# EAGLE board BDC-REV1 (EAGLE 9.6.2)
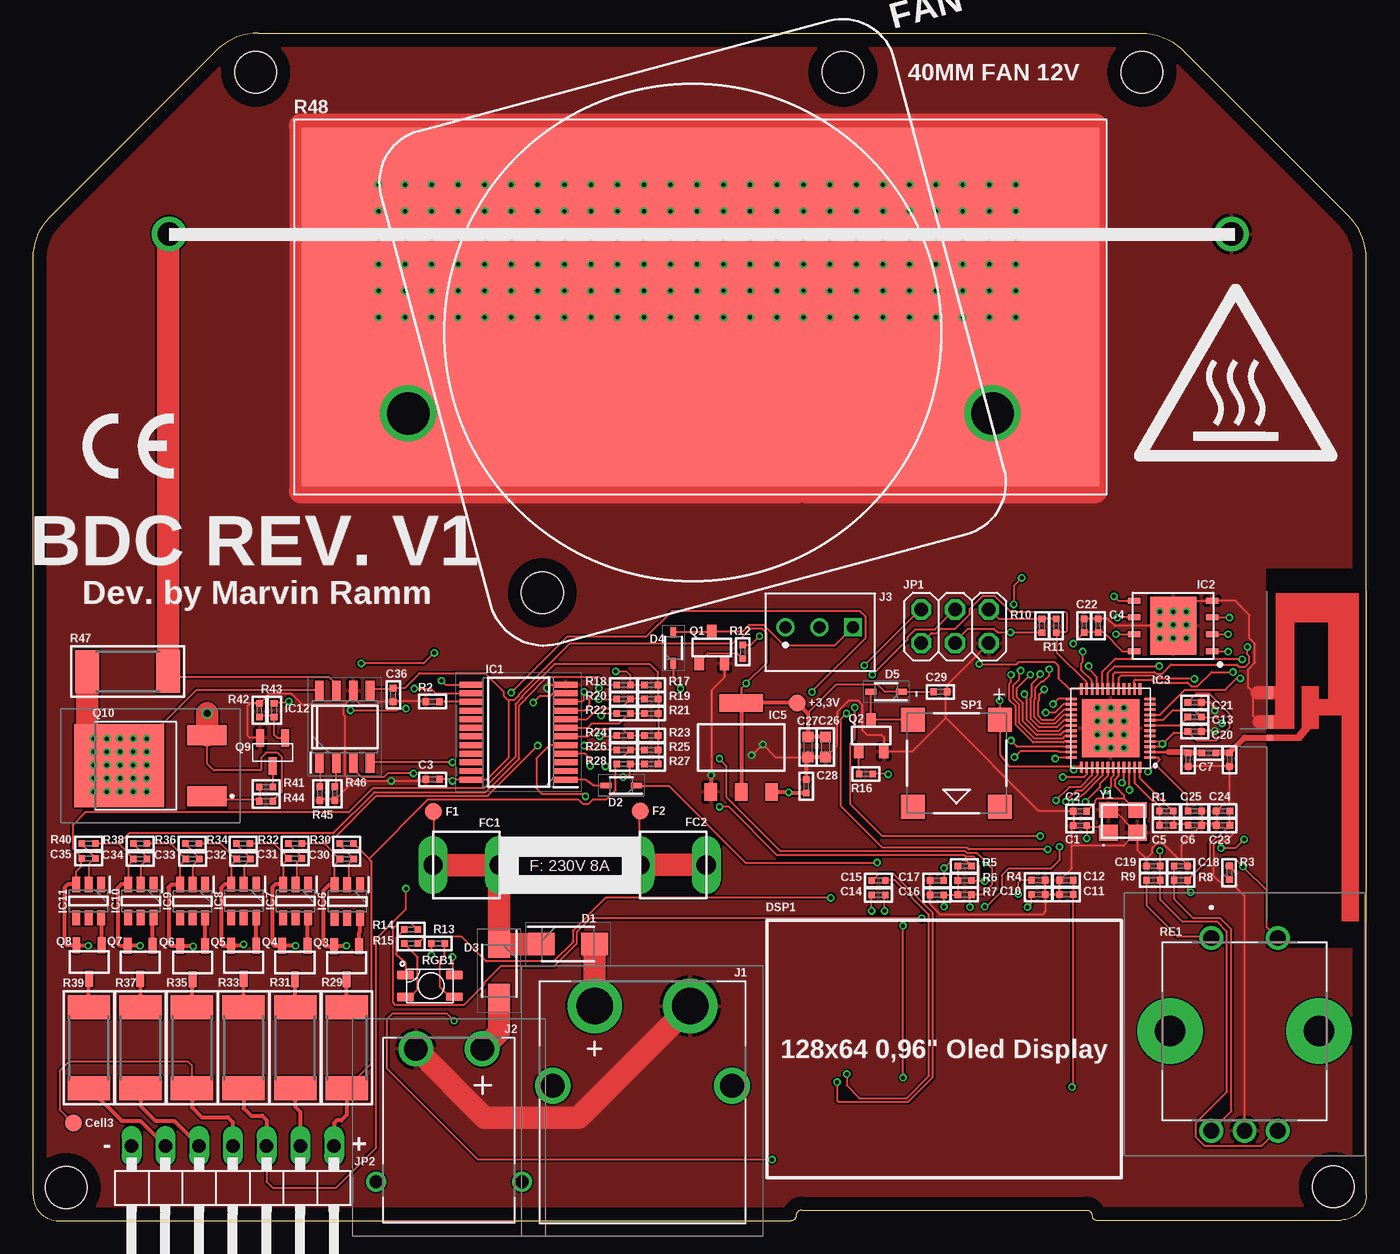
[diagram p2: board, top side]
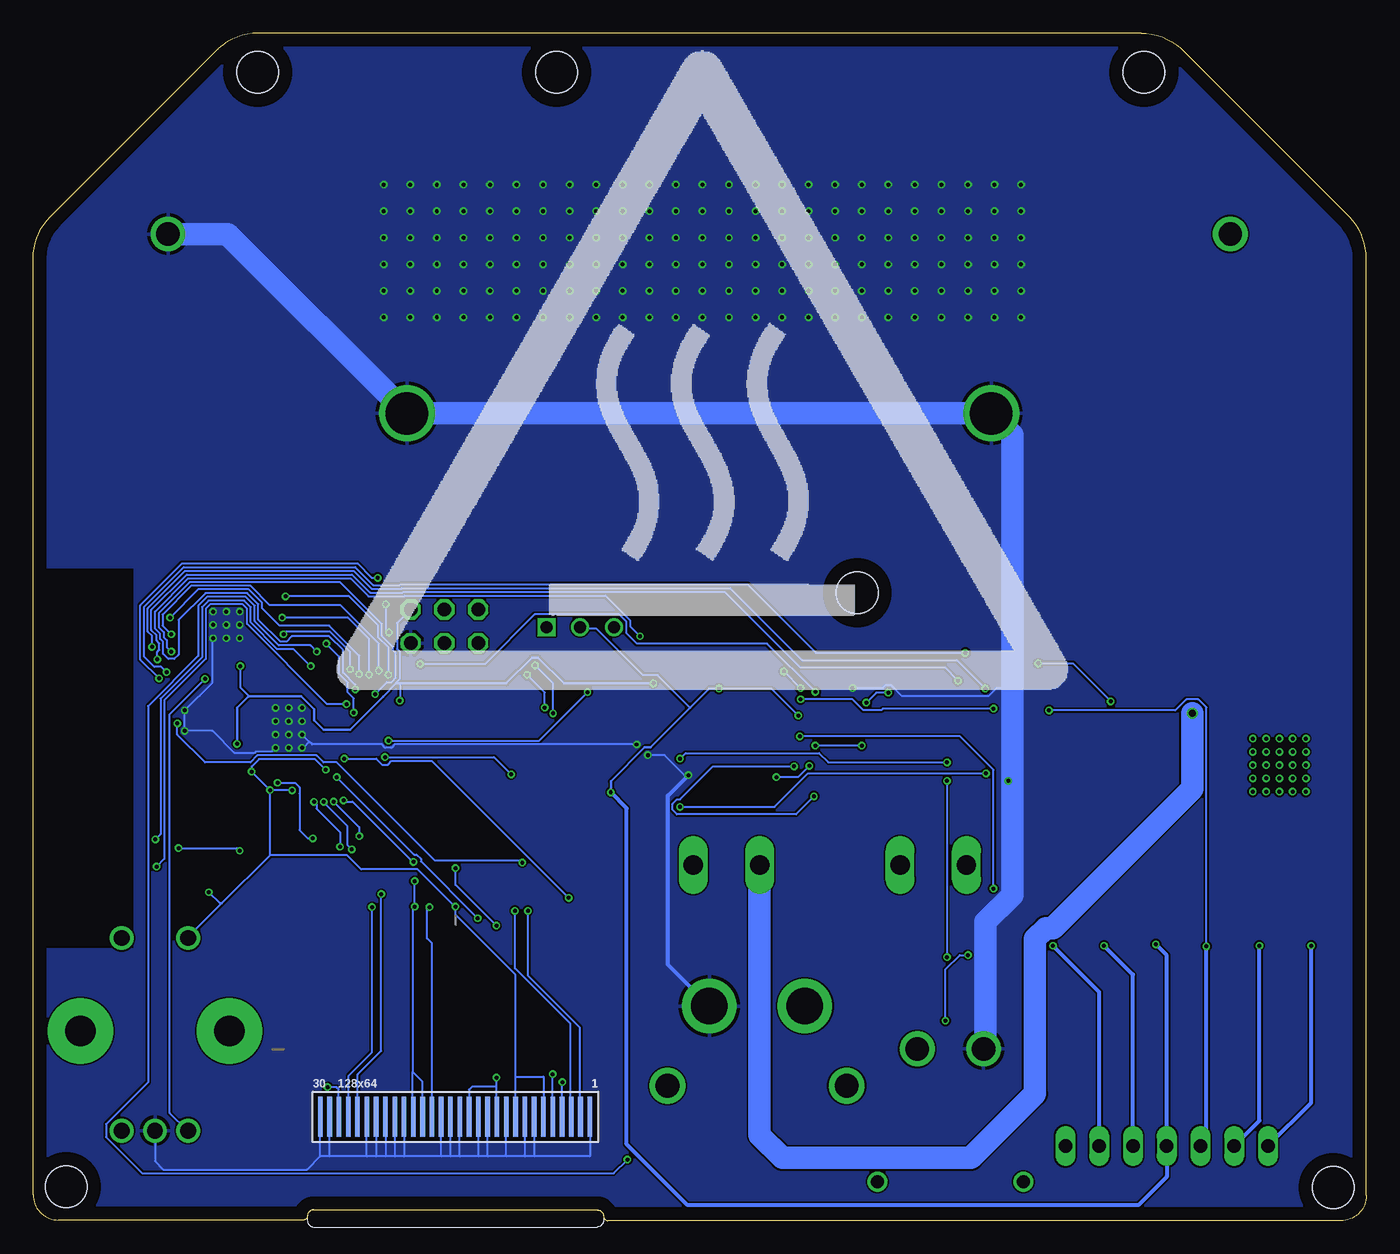
[diagram p3: board, bottom side, seen from below]

Size 100.4 x 89.4 mm. Coordinates in mm from the lower left corner, seen from the top.
Outline: 1.9,0 57.1,0 arc90 57.45,0.35 arc-90 57.9,0.8 79.3,0.8 arc-90 79.75,0.35 arc90 80.05,0.05 98.5,0.05 arc90 100.4,1.95 100.4,72.45 arc49 98.85,75.85 86.45,88.25 arc42 83.45,89.4 16.95,89.4 arc41 14,88.3 1.5,75.8 arc48 0,72.45 0,1.9 arc90 1.9,0
Copper layers (1*16): Top 0.035mm / dielectric 1.53mm / Bottom 0.035mm
Design rules "JLCPCB_1-2layer *": minimum track width 6mil, minimum drill 0.3mm, track to track 5mil, track to pad 0.2mm, pad to pad 7mil, via to via 7mil, smd to smd 7mil, copper to edge 40mil, drill to drill 6mil, minimum pad ring 6mil, minimum via ring 0.13mm, stop-mask expansion 0.1mm, vias tented up to drill 20mil, thermal gap 10mil
Holes 3.15 mm at 2.5,2.5 97.9,2.55 83.5,86.45 16.75,86.45
tRestrict: area 92.8,21.2 to 100.4,49.1; area 92.9,20.6 to 100.4,21.2; area 92.8,20.6 to 92.9,21.2
bRestrict: area 92.8,21.2 to 100.4,49.1; area 92.8,20.6 to 100.4,21.2; area 57.8,5.8 to 79.4,9.8

## Footprints (pad centres in the part's own frame; a part is rotated, then mirrored left to right if it is on the bottom)
C0402 = smd 0.5 x 0.5: 1 -0.508,0; 2 0.508,0
C0603 = smd 0.8 x 0.8: 1 -0.762,0; 2 0.762,0
SODFL5026X120N = smd 2.02 x 1.67: 1 -2,0; 2 2,0
SODFL2512X90N = smd 0.82 x 0.42: 1 -1.15,0; 2 1.15,0
2864KSWE_128X64I2C = smd 0.35 x 3: D1 0.175,1.5; D2 0.875,1.5; D3 1.575,1.5; D4 2.275,1.5; D5 2.975,1.5; D6 3.675,1.5; D7 4.375,1.5; D8 5.075,1.5; D9 5.775,1.5; D10 6.475,1.5; D11 7.175,1.5; D12 7.875,1.5; D13 8.575,1.5; D14 9.275,1.5; D15 9.975,1.5; D16 10.675,1.5; D17 11.375,1.5; D18 12.075,1.5; D19 12.775,1.5; D20 13.475,1.5; D21 14.175,1.5; D22 14.875,1.5; D23 15.575,1.5; D24 16.275,1.5; D25 16.975,1.5; D26 17.675,1.5; D27 18.375,1.5; D28 19.075,1.5; D29 19.775,1.5; D30 20.475,1.5
TRACE_ANTENNA_2.4GHZ_25.7MM_TUNED = smd 0.46 x 0.46: ANT 0,0.23 | smd 1 x 0.46: GND -1.18,0.23; GND2 -3.38,0.23
FUSECLIP = drill 1.448 pad 1.905 long: P1 0,0; P2 5,0
SOP65P780X200-24N = smd 1.8 x 0.45: 1 -3.55,3.575; 2 -3.55,2.925; 3 -3.55,2.275; 4 -3.55,1.625; 5 -3.55,0.975; 6 -3.55,0.325; 7 -3.55,-0.325; 8 -3.55,-0.975; 9 -3.55,-1.625; 10 -3.55,-2.275; 11 -3.55,-2.925; 12 -3.55,-3.575; 13 3.55,-3.575; 14 3.55,-2.925; 15 3.55,-2.275; 16 3.55,-1.625; 17 3.55,-0.975; 18 3.55,-0.325; 19 3.55,0.325; 20 3.55,0.975; 21 3.55,1.625; 22 3.55,2.275; 23 3.55,2.925; 24 3.55,3.575
SON127P800X600X80-9N = smd 0.95 x 0.45: 1 -2.85,1.905; 2 -2.85,0.635; 3 -2.85,-0.635; 4 -2.85,-1.905; 5 3,-1.905; 6 3,-0.635; 7 3,0.635; 8 3,1.905 | smd 3.45 x 4.35: 9 0.05,0
QFN40P600X600X90-49N = smd 0.85 x 0.2: 1 -2.95,2.2; 2 -2.95,1.8; 3 -2.95,1.4; 4 -2.95,1; 5 -2.95,0.6; 6 -2.95,0.2; 7 -2.95,-0.2; 8 -2.95,-0.6; 9 -2.95,-1; 10 -2.95,-1.4; 11 -2.95,-1.8; 12 -2.95,-2.2; 25 2.95,-2.2; 26 2.95,-1.8; 27 2.95,-1.4; 28 2.95,-1; 29 2.95,-0.6; 30 2.95,-0.2; 31 2.95,0.2; 32 2.95,0.6; 33 2.95,1; 34 2.95,1.4; 35 2.95,1.8; 36 2.95,2.2 | smd 0.2 x 0.85: 13 -2.2,-2.95; 14 -1.8,-2.95; 15 -1.4,-2.95; 16 -1,-2.95; 17 -0.6,-2.95; 18 -0.2,-2.95; 19 0.2,-2.95; 20 0.6,-2.95; 21 1,-2.95; 22 1.4,-2.95; 23 1.8,-2.95; 24 2.2,-2.95; 37 2.2,2.95; 38 1.8,2.95; 39 1.4,2.95; 40 1,2.95; 41 0.6,2.95; 42 0.2,2.95; 43 -0.2,2.95; 44 -0.6,2.95; 45 -1,2.95; 46 -1.4,2.95; 47 -1.8,2.95; 48 -2.2,2.95 | smd 4.35 x 4.35: 49 0,0
SOT229P700X180-4N = smd 1.3 x 0.95: 1 -3.35,2.29; 2 -3.35,0; 3 -3.35,-2.29 | smd 1.3 x 3.25: 4 3.35,0
SOT95P280X140-6N = smd 1.15 x 0.6: 1 -1.25,0.95; 2 -1.25,0; 3 -1.25,-0.95; 4 1.25,-0.95; 5 1.25,0; 6 1.25,0.95
SOIC127P600X175-8N = smd 1.528 x 0.65: 1 -2.711,1.905; 2 -2.711,0.635; 3 -2.711,-0.635; 4 -2.711,-1.905; 5 2.711,-1.905; 6 2.711,-0.635; 7 2.711,0.635; 8 2.711,1.905
XT60PWM = drill 2.75 pad 4.1: 1 -3.6,0; 2 3.6,0 | drill 1.8 pad 2.7: 3 6.75,6; 4 -6.75,6
XT30PWM = drill 1.75 pad 2.6: 1 -2.5,-5.912; 2 2.5,-5.912 | drill 1 pad 1.5: 3 5.5,4.088; 4 -5.5,4.088
2510-3A = drill 0.9: 1 0.02,-0.01; 2 2.56,-0.01 | drill 0.9 square: 3 5.1,-0.01
2X03 = drill 1.016 octagon: 1 -2.54,-1.27; 2 -2.54,1.27; 3 0,-1.27; 4 0,1.27; 5 2.54,-1.27; 6 2.54,1.27
1X07/90 = drill 1.016 long: 1 -7.62,-3.81; 2 -5.08,-3.81; 3 -2.54,-3.81; 4 0,-3.81; 5 2.54,-3.81; 6 5.08,-3.81; 7 7.62,-3.81
SOT95P240X120-3N = smd 1 x 0.7: 1 -1.2,0.95; 2 -1.2,-0.95; 3 1.2,0
FSS2302SA2SHB = smd 1.2 x 0.6: D 1.25,0; G -1.25,0.95; S -1.25,-0.95
SOT95P237X112-3N = smd 1.3 x 0.6: 1 -1.05,0.95; 2 -1.05,-0.95; 3 1.05,0
AOD480 = smd 1.5 x 3: 1 -2.286,-8.4; 3 2.286,-8.4 | smd 6.25 x 6.8: 2 0,-1.8
R0402 = smd 0.5 x 0.5: 1 -0.508,0; 2 0.508,0
R2512 = smd 1.8 x 3.2: 1 -3.048,0; 2 3.048,0
RX24_100W = drill 1.75: 1 -16.2,14.7; 2 63.8,14.7 | drill 3.2: GND 1.8,1.2; GND2 45.8,1.2 | smd 60 x 27: GND3 23.8,9.2
PEC12R4230FS0024 = drill 1.2 pad 1.8: 1 0,0; 2 5,0; A1 0,-14.5; B1 5,-14.5; C1 2.5,-14.5 | drill 2.3 pad 4.92: MH1 -3.1,-7; MH2 8.1,-7
RGBLED = smd 0.686 x 1.3: +5V -1.456,1.996; P1 0.184,1.996; P2 -1.458,-1.678; P3 0.192,-1.678
XDCR_CMT-7525-80-SMT-TR = smd 1.8 x 1.8: 1 3.275,3.275; 2 3.275,-3.275; N -3.275,-3.275; P -3.275,3.275
PAD.03X.05 = smd 1.27 x 1.27: P$1 0,0
40MMFAN = hole 3.15: 4.45,4.06; 36.45,36.06
SMD3225_4P16MHZ20PF10PPM4085 = smd 1.4 x 1.2: 1 -1.1,-0.85; 2 1.1,-0.85; 3 1.1,0.85; 4 -1.1,0.85

## Placement (x,y rotation side)
C1  12pF  [C0402]  78.83,29.75 0 top
C2  12pF  [C0402]  78.83,30.82 0 top
C3  0,1µF  [C0402]  30.09,33.23 180 top
C4  0,1uF  [C0402]  80.21,44.8 270 top
C5  3nF  [C0402]  85.33,29.77 180 top
C6  10nF  [C0402]  87.48,29.77 180 top
C7  5,6pF  [C0402]  88.53,35.22 0 top
C8  DNP  [C0402]  90.09,34.71 90 top
C9  DNP  [C0402]  86.98,34.71 90 top
C10  1µF  [C0402]  75.69,24.56 180 top
C11  1µF  [C0402]  77.8,24.56 0 top
C12  1µF  [C0402]  77.8,25.63 0 top
C13  270pF  [C0402]  87.47,37.92 180 top
C14  1µF  [C0402]  63.66,24.52 0 top
C15  1µF  [C0402]  63.66,25.6 0 top
C16  1µF  [C0402]  68.06,24.53 180 top
C17  1µF  [C0402]  68.06,25.62 180 top
C18  10nF  [C0402]  86.43,26.69 0 top
C19  10nF  [C0402]  84.35,26.69 180 top
C20  0,1uF  [C0402]  87.47,36.83 180 top
C21  0,1uF  [C0402]  87.47,39.01 180 top
C22  1uF  [C0402]  79.14,44.8 270 top
C23  100pF  [C0402]  89.61,29.77 0 top
C24  0,1uF  [C0402]  89.61,30.84 0 top
C25  0,1uF  [C0402]  87.48,30.84 180 top
C26  10µF  [C0603]  59.67,35.66 270 top
C27  10µF  [C0603]  58.35,35.66 270 top
C28  4,7uF  [C0402]  58.22,32.7 270 top
C29  1uF  [C0402]  68.32,39.82 0 top
C30  100nF  [C0402]  23.62,27.23 180 top
C31  100nF  [C0402]  19.73,27.28 180 top
C32  100nF  [C0402]  15.84,27.23 180 top
C33  100nF  [C0402]  12,27.23 180 top
C34  100nF  [C0402]  8.06,27.23 180 top
C35  100nF  [C0402]  4.17,27.28 180 top
C36  100nF  [C0402]  27.11,39.58 270 top
D1  SK53AFL-TP  [SODFL5026X120N]  40.27,20.83 0 top
D2  1N4148WS  [SODFL2512X90N]  44.29,32.77 180 top
D3  SK53AFL-TP  [SODFL5026X120N]  35.09,18.81 270 top
D4  1N4148WS  [SODFL2512X90N]  48.22,43.13 90 top
D5  1N4148WS  [SODFL2512X90N]  64.25,39.82 180 top
DSP1  2864KSWE_128X64I2C  [2864KSWE_128X64I2C]  78.95,6.32 0 bottom
E1  ANTENNA  [TRACE_ANTENNA_2.4GHZ_25.7MM_TUNED]  92.89,36.37 270 top
FC1  FUSECLIPS  [FUSECLIP]  30.11,26.77 0 top
FC2  FUSECLIPS  [FUSECLIP]  50.69,26.78 180 top
IC1  CD74HC4067SM96  [SOP65P780X200-24N]  36.55,36.78 180 top
IC2  W25Q128JVPIQ  [SON127P800X600X80-9N]  85.92,44.78 180 top
IC3  ESP32-D0WDQ6  [QFN40P600X600X90-49N]  81.14,37.08 180 top
IC5  AMS1117-3.3  [SOT229P700X180-4N]  53.33,35.63 90 top
IC6  HY2213-BB3A  [SOT95P280X140-6N]  23.66,24.04 270 top
IC7  HY2213-BB3A  [SOT95P280X140-6N]  19.76,24.06 270 top
IC8  HY2213-BB3A  [SOT95P280X140-6N]  15.86,24.08 270 top
IC9  HY2213-BB3A  [SOT95P280X140-6N]  12.01,24.05 270 top
IC10  HY2213-BB3A  [SOT95P280X140-6N]  8.11,24.07 270 top
IC11  HY2213-BB3A  [SOT95P280X140-6N]  4.18,24.06 270 top
IC12  INA219AIDR  [SOIC127P600X175-8N]  23.47,37.18 90 top
J1  XT60PW-M  [XT60PWM]  45.88,16.16 180 top
J2  XT30PW-M  [XT30PWM]  31.32,7.02 180 top
J3  2510-3A  [2510-3A]  56.65,44.7 0 top
JP1  [2X03]  69.43,44.75 0 top
JP2  [1X07/90]  15.03,1.82 180 top
Q1  MMBT3904  [SOT95P240X120-3N]  51.11,43.15 90 top
Q2  MMBT3904  [SOT95P240X120-3N]  63.11,36.52 90 top
Q3  FSS2302SA2SHB  [FSS2302SA2SHB]  23.61,19.42 270 top
Q4  FSS2302SA2SHB  [FSS2302SA2SHB]  19.71,19.44 270 top
Q5  FSS2302SA2SHB  [FSS2302SA2SHB]  15.86,19.46 270 top
Q6  FSS2302SA2SHB  [FSS2302SA2SHB]  12.01,19.43 270 top
Q7  FSS2302SA2SHB  [FSS2302SA2SHB]  8.06,19.45 270 top
Q8  FSS2302SA2SHB  [FSS2302SA2SHB]  4.21,19.47 270 top
Q9  SI2302DDS-T1-GE3  [SOT95P237X112-3N]  18.04,35.29 270 top
Q10  AOD403  [AOD480]  4.68,34.25 90 top
R1  20kΩ  [R0402]  85.33,30.83 0 top
R2  10kΩ  [R0402]  30.07,39.07 180 top
R3  10kΩ  [R0402]  90.08,26.19 270 top
R4  390kΩ  [R0402]  75.7,25.63 0 top
R5  10kΩ  [R0402]  70.15,26.69 180 top
R6  10kΩ  [R0402]  70.15,25.62 0 top
R7  10kΩ  [R0402]  70.15,24.54 0 top
R8  10kΩ  [R0402]  86.43,25.63 180 top
R9  10kΩ  [R0402]  84.35,25.63 0 top
R10  10kΩ  [R0402]  75.97,44.79 90 top
R11  10kΩ  [R0402]  77.04,44.79 270 top
R12  1kΩ  [R0402]  53.43,42.82 270 top
R13  2,2kΩ  [R0402]  30.49,20.86 180 top
R14  2,2kΩ  [R0402]  28.45,21.93 0 top
R15  2,2kΩ  [R0402]  28.45,20.86 0 top
R16  1kΩ  [R0402]  62.71,33.62 180 top
R17  365kΩ  [R0402]  46.55,40.33 180 top
R18  100kΩ  [R0402]  44.46,40.33 0 top
R19  64,9kΩ  [R0402]  46.55,39.27 180 top
R20  100kΩ  [R0402]  44.46,39.27 0 top
R21  35,7kΩ  [R0402]  46.55,38.19 180 top
R22  100kΩ  [R0402]  44.46,38.19 0 top
R23  24,9kΩ  [R0402]  46.55,36.52 180 top
R24  100kΩ  [R0402]  44.46,36.52 0 top
R25  18,7kΩ  [R0402]  46.55,35.44 180 top
R26  100kΩ  [R0402]  44.46,35.44 0 top
R27  15kΩ  [R0402]  46.55,34.37 180 top
R28  100kΩ  [R0402]  44.46,34.37 0 top
R29  62Ω  [R2512]  23.62,13.02 270 top
R30  100Ω  [R0402]  23.61,28.39 180 top
R31  62Ω  [R2512]  19.73,13.02 270 top
R32  100Ω  [R0402]  19.74,28.39 180 top
R33  62Ω  [R2512]  15.85,13.02 270 top
R34  100Ω  [R0402]  15.82,28.39 180 top
R35  62Ω  [R2512]  11.97,13.02 270 top
R36  100Ω  [R0402]  11.98,28.39 180 top
R37  62Ω  [R2512]  8.08,13.02 270 top
R38  100Ω  [R0402]  8.07,28.39 180 top
R39  62Ω  [R2512]  4.19,13.02 270 top
R40  100Ω  [R0402]  4.18,28.39 180 top
R41  1kΩ  [R0402]  17.54,32.66 180 top
R42  100kΩ  [R0402]  17.05,38.44 90 top
R43  1kΩ  [R0402]  18.15,38.44 270 top
R44  100kΩ  [R0402]  17.54,31.58 180 top
R45  10kΩ  [R0402]  21.6,32.16 90 top
R46  10kΩ  [R0402]  22.73,32.16 90 top
R47  0,01Ω  [R2512]  7.12,41.35 0 top
R48  RX24  [RX24_100W]  26.45,59.58 0 top
RE1  PEC12R-4230F-S0024  [PEC12R4230FS0024]  88.73,21.28 0 top
RGB1  RGBLED  [RGBLED]  29.71,17.04 270 top
SP1  CMT-7525-80-SMT-TR  [XDCR_CMT-7525-80-SMT-TR]  69.54,34.44 270 top
TP1  TEST-POINT3X5  [PAD.03X.05]  30.14,30.79 0 top
TP2  TEST-POINT3X5  [PAD.03X.05]  57.55,38.99 0 top
TP3  TEST-POINT3X5  [PAD.03X.05]  45.71,30.84 0 top
TP4  TEST-POINT3X5  [PAD.03X.05]  3.02,7.34 0 top
U$1  40MMFAN  [40MMFAN]  35.1,42.2 15 top
Y1  SMD-3225_4P16MHZ_20PF_10PPM_-4  [SMD3225_4P16MHZ20PF10PPM4085]  82.07,30.07 0 top

## Tracks (layer width: path | path; a pad name or v marks a point on that pad's centre or on a via)
0-BOOT
  Top 0.152: IC3.23 79.34,40.55 77.11,42.77 77.11,44.21 R11.2 77.74,44.28 77.87,44.41 77.87,45.71 77.73,45.84 73.62,45.84 72.41,47.06 71.54,47.06 70.55,46.07 70.55,45.67 69.44,44.56 68.37,44.56 68.04,44.24 67.65,44.24 JP1.1
1_B1  (via drill 0.3)
  Top 0.152: 6.43,28.36 4.75,28.36 R40.1 | 6.43,28.36 C34.2 7.55,27.16 7.16,26.77 IC10.3 | R18.1 43.22,40.32 42.61,40.93 38.7,40.93 37.12,39.35 37.12,39.29 36.6,38.77 36.6,34.78 34.09,32.27 25.7,32.27 22.63,29.2 7.26,29.2 6.43,28.36
  Top 0.305: R39.2 6.66,7.51 8.07,7.51 JP2.6 | IC10.3 6.62,25.32 6.35,25.05 6.35,20.85 6.5,20.7 Q7.S v8.05,20.7
  Bottom 0.305: JP2.6 8.05,7.53 v8.05,20.7
1_B2  (via drill 0.3)
  Top 0.152: IC9.3 11.03,25.33 11.03,26.74 11.48,27.2 C33.2 11.46,27.24 10.34,28.36 8.66,28.36 R38.1 | v42.61,39.26 43.87,39.26 R20.1 | v28.08,38.56 27.52,38.56 27.38,38.42 v23.89,38.42
  Top 0.305: R37.2 8.08,8.62 9.19,7.51 10.61,7.51 JP2.5 | IC9.3 10.4,25.3 10.2,25.1 10.2,20.85 10.37,20.68 Q6.S 11.09,20.65 v12.05,20.65
  Bottom 0.152: v23.89,38.42 14.39,38.42 13.55,39.25 12.66,39.25 12.05,38.64 v12.05,20.65 | v42.61,39.26 38.69,39.26 37.88,38.44 36.52,38.44 36.41,38.56 v28.08,38.56
  Bottom 0.305: JP2.5 12.05,6.07 v12.05,20.65
1_B3  (via drill 0.3)
  Top 0.152: IC8.3 14.91,26.81 C32.2 15.23,27.24 14.11,28.36 12.57,28.36 R36.1 | R22.1 43.94,38.18 42.93,38.18 v42.78,38.03 | TP4.P$1 2.99,7.34 1.99,8.34 1.99,11.29 2.67,11.98 11.66,11.98 11.97,11.66 R35.2
  Top 0.203: D4.1 48.22,40.58 v48.75,40.05
  Top 0.305: R35.2 11.97,8.53 12.7,7.8 14.65,7.8 15.03,7.42 JP2.4 | IC8.3 14.43,25.33 14.15,25.05 14.15,20.8 14.24,20.71 Q5.S 15.76,20.71 v15.85,20.8 | IC5.3 55.65,32.25 v56.9,32.25 56.96,32.19 C28.2
  Bottom 0.152: 50.92,38.63 53.37,41.07 54.48,41.07 57.98,44.56 59.09,44.56 J3.2 | v42.78,38.03 44.8,40.05 v48.75,40.05
  Bottom 0.2: v48.75,40.05 49.5,40.05 50.92,38.63
  Bottom 0.203: 50.92,38.63 53.92,35.63 54.34,35.63 56.9,33.07 v56.9,32.25
  Bottom 0.305: v15.85,20.8 15.03,19.98 JP2.4 15.03,3.32 17.18,1.17 51.12,1.17 55.7,5.75 55.7,31.05 v56.9,32.25
1_B4  (via drill 0.3)
  Top 0.152: R34.1 16.34,28.36 18.16,28.36 19.14,27.38 C31.2 18.81,26.87 IC7.3 | v28.08,25.01 28.08,23.47 25.84,21.23 25.84,5.49 22.83,2.48 18.02,2.48 17.57,2.93 JP2.3 | v42.66,36.46 43.89,36.46 R24.1
  Top 0.305: R33.2 15.85,8.45 16.4,7.9 17.25,7.9 17.57,7.58 JP2.3 | IC7.3 18.21,25.31 18,25.1 18,20.85 18.16,20.69 Q4.S v19.74,20.69 v19.75,20.7
  Bottom 0.152: v42.66,36.46 30.59,36.46 28.08,33.95 v28.08,25.01
  Bottom 0.305: JP2.3 17.57,18.52 v19.75,20.7
1_B5  (via drill 0.3)
  Top 0.152: 21.93,28.36 20.26,28.36 R32.1 | 21.93,28.36 23.05,27.24 C30.2 23.1,27.2 22.67,26.77 22.67,25.33 IC6.3 | v41.49,35.76 41.77,35.48 43.87,35.48 R26.1 | v38,35.76 34.23,31.99 25.84,31.99 22.77,28.92 22.49,28.92 21.93,28.36
  Top 0.305: R31.2 19.73,8.57 20.11,8.19 JP2.2 | IC6.3 22.29,25.29 21.85,24.85 21.85,20.8 21.98,20.67 Q3.S 23.57,20.67 v23.6,20.7
  Bottom 0.152: v38,35.76 v41.49,35.76
  Bottom 0.305: JP2.2 20.11,17.21 v23.6,20.7
1_B6
  Top 0.152: 25.29,27.24 24.17,28.36 R30.1 | 25.29,27.24 29.76,31.71 41.05,31.71 41.37,31.39 41.83,31.39 42.15,31.71 43.17,31.71 43.87,32.41 43.87,34.37 R28.1 | R29.2 25.5,11.85 25.5,27.03 25.29,27.24
  Top 0.305: R29.2 23.62,7.97 23.2,7.55 22.85,7.55 22.65,7.35 JP2.1
1_B+  (via drill 0.55)
  Top 0.152: R44.1 18.16,31.71 18.72,32.27 18.72,34.92 18.4,35.24 17.54,35.24 17.15,34.85 17.15,33.95 17.1,33.9 13.6,33.9 13.1,34.4 13.1,36.56 | TP3.P$1 45.68,30.73 45.68,27.52 FC2.P2
  Top 1.7: FC2.P2 FC2.P1 | v13.1,38.2 13.1,36.56 Q10.3
  Bottom 1.7: FC2.P2 45.69,6.44 43.98,4.73 29.77,4.73 24.95,9.55 24.95,21.23 24.15,22.03 23.6,22.03 13.1,32.53 v13.1,38.2
1_B-  (via drill 0.3)
  Top 0.152: R27.1 47.08,34.51 47.08,35.34 R25.1 47.08,35.48 47.08,36.46 R23.1 47.08,36.6 47.08,38.14 R21.1 47.08,38.28 47.08,39.26 R19.1 47.08,39.4 47.08,40.23 R17.1 47.06,41.3 46.45,41.91 39.26,41.91 36.84,39.49 36.84,39.4 36.32,38.89 36.32,34.92 33.95,32.55 25.57,32.55 23.75,30.73 3.93,30.73 2.97,29.78 2.97,28.04 3.63,27.38 C35.2 3.63,27.24 3.63,26.67 3.25,26.29 3.25,25.33 IC11.3
  Top 0.305: IC11.3 2.61,25.31 2.35,25.05 2.35,20.9 2.53,20.72 Q8.S 3.28,20.7 v4.15,20.7
  Bottom 0.305: JP2.7 4.15,8.89 v4.15,20.7
1_S1  (via drill 0.3)
  Top 0.152: R17.2 R18.2 44.97,41.05 44.67,41.35 v43.87,41.35 | v42.61,40.09 41.9,39.39 41.9,38.74 41.58,38.42 40.11,38.42 IC1.9
  Bottom 0.152: v42.61,40.09 v43.87,41.35
1_S2
  Top 0.152: R19.2 46.03,39.3 44.97,39.3 R20.2 44.41,38.72 43.59,38.72 43.45,38.58 42.55,38.58 41.72,37.76 IC1.8
1_S3
  Top 0.152: R21.2 46.03,38.18 44.98,38.18 R22.2 44.9,38.19 44.15,37.44 42.1,37.44 41.77,37.11 IC1.7
1_S4
  Top 0.152: R23.2 46.02,36.5 44.99,36.5 R24.2 44.92,36.52 44.4,37.05 42.41,37.05 41.82,36.46 40.11,36.46 IC1.6
1_S5  (via drill 0.3)
  Top 0.152: 44.98,35.48 45.96,35.48 R25.2 | 44.98,35.48 R26.2 | IC1.5 38.91,35.8 37.9,34.8 37.9,32.55 38.3,32.15 41.4,32.15 v41.6,31.95 | v43.1,34.2 43.43,34.53 43.43,34.73 43.59,34.9 44.4,34.9 44.98,35.48
  Bottom 0.152: v41.6,31.95 42.95,30.6 51.92,30.6 52.24,30.92 52.24,31.38 51.92,31.71 51.69,31.71 49.2,34.2 v43.1,34.2
1_S6  (via drill 0.3)
  Top 0.152: R27.2 45.96,34.37 44.98,34.37 R28.2 44.94,34.37 44.94,33.56 44.77,33.39 v44.42,33.39 | v41.94,34.25 41.94,34.8 41.57,35.16 IC1.4
  Bottom 0.152: v44.42,33.39 42.8,33.39 v41.94,34.25
2-LED_BLUE  (via drill 0.3)
  Top 0.152: IC3.22 79.72,40.05 79.72,40.67 78.94,41.44 78.94,41.98 79.05,42.09 v79.05,42.85 | v55.65,4.6 33.5,4.6 26.65,11.45 26.65,15.2 27.05,15.6 31.15,15.6 v31.7,15.05 | v30,20 30,20.84 R13.2
  Bottom 0.152: v31.7,15.05 31.7,18.92 30.62,20 v30,20 | v55.65,4.6 56.68,3.57 92.18,3.57 94.91,6.29 94.91,7.27 91.76,10.42 91.76,38.74 87.97,42.53 87.97,46.31 87.31,46.97 84.39,46.97 83.72,46.3 83.72,45.14 81.9,43.31 79.51,43.31 v79.05,42.85
4-S0  (via drill 0.3)
  Top 0.152: v41.49,39.81 41.49,39.23 41.37,39.12 40.23,39.12 IC1.10 | v71.25,41.91 74.08,41.91 74.24,42.07 76.9,42.07 77.2,41.77 77.2,40.85 78.02,40.03 IC3.24
  Bottom 0.152: v71.25,41.91 66.36,41.91 62.63,45.64 56.28,45.64 55.72,45.08 55.72,44.23 54.93,43.44 45.12,43.44 v41.49,39.81
5-S1  (via drill 0.3)
  Top 0.152: IC3.34 74.12,35.68 v73.65,36.15 | v58.65,39.8 58.65,39.85 62.7,43.9 62.7,45.48 62.28,45.9 48.1,45.9 46.15,43.95 40.2,43.95 v36,39.75 | v37.65,39 38.19,39.54 38.97,39.54 39.13,39.7 IC1.11
  Bottom 0.152: v73.65,36.15 62.3,36.15 v58.65,39.8 | v36,39.75 36.9,39.75 v37.65,39
12-S2  (via drill 0.3)
  Top 0.152: v91.45,43.2 91.45,42.64 91.61,42.48 91.61,42.02 91.28,41.69 90.82,41.69 90.66,41.86 85.69,41.86 85.03,41.19 84.57,41.19 84.47,41.29 81.48,41.29 81.34,41.15 IC3.18 | v28.7,40.05 29.95,40.05 30.3,39.7 IC1.14
  Bottom 0.152: v91.45,43.2 91.45,44.02 91.77,44.34 91.77,46.09 88.95,48.92 76.27,48.92 74.91,47.56 72.68,47.56 72.63,47.62 47.92,47.62 42.5,42.2 30.85,42.2 v28.7,40.05
13-S3  (via drill 0.3)
  Top 0.152: v91.05,42.25 91.01,42.29 89.77,42.29 89.76,42.31 81.5,42.31 80.54,41.35 IC3.20 | v30.75,40.65 31.05,40.35 IC1.13
  Bottom 0.152: v30.75,40.65 31.75,41.65 42.65,41.65 48.34,47.34 72.52,47.34 72.57,47.28 75.03,47.28 76.38,48.64 88.83,48.64 91.49,45.98 91.49,44.46 91.11,44.08 91.11,43.69 90.89,43.47 90.89,42.97 91.05,42.81 v91.05,42.25
14-ENC_A  (via drill 0.3)
  Top 0.152: C18.1 85.92,25.7 R8.2 85.95,25.61 85.95,24.21 87.39,22.77 89.41,22.77 90.25,21.93 90.25,8.24 88.85,6.84 RE1.A1 | IC3.17 81.74,40.85 81.91,41.01 84.36,41.01 84.58,40.79 v87.45,40.79
  Bottom 0.152: v87.45,40.79 90.11,38.14 90.11,8.1 88.85,6.84 RE1.A1
15-ENC_B  (via drill 0.3)
  Top 0.152: IC3.21 80.12,40.05 80.12,40.92 79.5,41.54 v79.5,41.75 | v91.2,28.7 90.55,28.05 v89.45,28.05 | v84.85,27.85 C19.1 84.84,26.67 84.84,25.65 R9.2 84.86,24.2 86.56,22.49 89.18,22.49 89.91,21.77 89.91,9.72 87.55,7.37 87.55,6.29 88.24,5.6 92.5,5.6 93.67,6.78 RE1.B1
  Bottom 0.152: v89.45,28.05 85.05,28.05 v84.85,27.85 | v91.2,28.7 90.8,29.1 90.8,39.3 87.69,42.41 87.69,46.2 87.2,46.69 84.5,46.69 84.01,46.2 84.01,45.04 82.01,43.03 80.78,43.03 v79.5,41.75
16-ENC_SW  (via drill 0.3)
  Top 0.152: R3.2 90.03,25.69 89.55,26.17 89.55,27.1 89.69,27.24 90.53,27.24 v91.11,26.66 92.9,24.87 92.9,22.07 93.6,21.37 RE1.2 | IC3.25 77.19,39.28 v76.81,38.89
  Bottom 0.152: v91.11,26.66 90.52,27.25 90.52,39.18 87.41,42.3 87.41,46.08 87.08,46.41 84.62,46.41 84.29,46.08 84.29,44.92 78.27,38.89 v76.81,38.89
17-FAN  (via drill 0.3)
  Top 0.152: IC3.27 77.63,38.48 76.84,37.69 76.02,37.69 75.69,38.02 75.69,39.12 75.77,39.19 75.77,39.62 v76.15,40 | v54.7,44 54.03,43.33 R12.1
  Bottom 0.152: v76.15,40 76.15,40.36 77.07,41.29 77.07,42.97 78.1,44 80.92,44 81.32,43.59 81.78,43.59 83.44,45.26 83.44,46.41 84.27,47.24 87.43,47.24 89.44,45.23 89.44,42.62 89.77,42.29 90.23,42.29 90.61,42.68 90.61,43.58 90.84,43.8 90.84,44.2 91.22,44.58 91.22,45.86 88.72,48.36 76.5,48.36 75.14,47.01 72.45,47.01 72.4,47.06 57.3,47.06 55.44,45.2 55.44,44.74 v54.7,44
18-BUZZER  (via drill 0.3)
  Top 0.152: IC3.35 77.27,35.28 77.2,35.34 74.34,35.34 v73.9,34.9 | v64.4,33.6 64.35,33.65 63.25,33.65 R16.1
  Bottom 0.152: v73.9,34.9 65.7,34.9 v64.4,33.6
19-LED_RED  (via drill 0.3)
  Top 0.152: IC3.38 79.34,33.61 79.11,33.39 v77.53,33.39 | R14.2 28.92,21.93 28.39,22.46 27.58,22.46 27.1,21.98 27.1,16.43 27.31,16.23 32.42,16.23 33.95,17.75 33.95,17.9 35.18,19.14 39.23,19.14 40.93,20.84 40.93,21.73 41.98,22.77 v66.92,22.77
  Bottom 0.152: v77.53,33.39 71.71,27.57 71.53,27.57 71.2,27.24 71.2,27.06 v66.92,22.77
21-SDA  (via drill 0.3)
  Top 0.152: v71.67,25.57 71.25,25.57 | 71.25,25.57 70.69,25.57 R6.2 | v28.64,33.67 26.68,33.67 26.4,33.39 24.72,33.39 24.17,33.94 24.17,34.37 IC12.3 | v51.69,31.15 52.39,31.15 56.02,27.52 70.1,27.52 70.23,27.39 70.85,27.39 71.2,27.04 71.2,26.78 71.25,26.73 71.25,25.57 | IC3.42 80.94,33.48 80.34,32.89 80.34,32.62 v79.25,31.53 | v77.3,28.15 77.3,27.15 76.65,26.5 73.45,26.5 72.95,26 72.95,24.8 71.8,23.65 v71.67,23.65
  Bottom 0.152: 71.82,11.2 71.82,23.5 v71.67,23.65 v71.67,25.57 | 71.82,11.2 71.82,7.82 DSP1.D11 | v28.64,33.67 42.05,33.67 44.56,31.15 v51.69,31.15 | 71.11,7.82 DSP1.D12 71.08,10.46 71.82,11.2 | v79.25,31.53 79.07,31.35 79.07,31.02 77.3,29.25 v77.3,28.15
22-SCL  (via drill 0.3)
  Top 0.152: v70.55,23.61 70.55,24.45 R7.2 70.7,24.59 71.47,24.59 72.22,25.34 72.22,26.55 v71.76,27.01 71.1,27.67 70.34,27.67 70.22,27.8 56.3,27.8 52.23,31.87 52.23,34.21 51.69,34.75 v51.69,34.78 | v31.57,34.51 25.43,34.51 IC12.4 | v77.04,31.65 78.03,32.64 78.86,32.64 79.74,33.52 IC3.39
  Bottom 0.152: v70.55,23.61 70.75,23.41 70.75,21.26 70.38,20.89 DSP1.D13 | v31.57,34.51 40.51,34.51 41.21,35.2 51.27,35.2 v51.69,34.78 | v77.04,31.65 76.94,31.55 76.35,31.55 71.81,27.01 v71.76,27.01
23-LED_GREEN  (via drill 0.3)
  Top 0.152: v76.97,34.78 76.99,34.78 77.09,34.88 IC3.36 | R15.2 29.49,21.39 32.26,21.39 34.12,19.52 39.2,19.52 40.65,20.98 40.65,21.84 43.12,24.31 v60.07,24.31
  Bottom 0.152: v76.97,34.78 74.57,34.78 74.13,34.34 73.67,34.34 73.39,34.62 70.38,34.62 v60.07,24.31
25-B1_ON  (via drill 0.3)
  Top 0.152: v30.2,42.75 29.4,41.95 v24.7,41.95 | v19.25,39.1 19.15,39 18.2,39 R43.1 | IC3.14 82.94,40.7 82.98,40.73 84.24,40.73 84.46,40.51 86.94,40.51 87.22,40.24 87.68,40.24 88.75,41.3 v90.35,41.3
  Bottom 0.152: v90.35,41.3 90.74,41.69 91.28,41.69 92.05,42.47 92.05,46.21 89.06,49.2 76.15,49.2 74.79,47.84 72.8,47.84 72.75,47.9 46.6,47.9 41.45,42.75 v30.2,42.75 | v24.7,41.95 22.1,41.95 v19.25,39.1
39-BVCC  (via drill 0.3)
  Top 0.152: v89.55,37.44 89.13,37.86 88.01,37.86 C13.1 87.45,38.45 85.84,38.45 85.1,37.7 84.11,37.7 IC3.8 | v63.56,26.96 53.65,26.96 47.87,32.74 45.48,32.74 D2.1
  Bottom 0.152: v89.55,37.44 89.55,36.6 87.45,34.51 84.04,34.51 83.52,35.03 79.06,35.03 78.53,34.51 77.53,34.51 70.13,27.1 63.7,27.1 v63.56,26.96
+3V3  (via drill 0.3)
  Top 0.152: v85.05,35.9 84.83,35.68 IC3.3 | IC3.4 84.87,36.08 v85.05,35.9 | v72.8,39.15 72.8,37.73 SP1.P 72.81,35.08 73.49,34.23 78.37,34.23 | v68.6,23.65 68.6,24.5 C16.1 R7.1 R6.1 R5.2 | C24.2 90.11,30.73 90.11,29.9 C23.2 89.23,28.89 89.1,28.89 88.61,28.4 88.61,27.31 R8.1 86.93,24.97 v87.17,24.73 | IC3.1 84.7,34.88 84.87,34.72 84.52,34.37 | 84.52,34.37 86.89,31.99 86.89,30.92 C25.2 | R9.1 83.84,23.73 86.2,21.37 88.71,21.37 RE1.1 | v82.56,32.41 82.56,34.09 IC3.46 | v83.96,33.81 84.52,34.37 | IC12.5 25.5,40.05 27.11,40.05 C36.1 27.24,40.09 27.96,40.09 29.1,41.23 34.05,41.23 35.44,39.84 35.44,39.52 35.77,39.19 35.83,39.19 | 31.57,33.2 IC1.24 33.11,33.25 34.2,33.25 35.83,34.88 35.83,39.19 | C3.1 30.73,33.25 31.57,33.25 31.57,33.2 | v31.57,19.84 31.57,18.58 RGB1.+5V | 31.57,33.2 v31.57,33.11 | R11.1 R10.2 72.74,45.3 72.08,45.96 JP1.6 | C29.1 67.75,39.81 65.52,39.81 D5.1 65.38,39.8 64.13,39.8 63.56,40.37 60.49,40.37 58.33,38.21 | v85.05,35.9 85.08,35.9 85.92,36.74 86.89,36.74 C20.2 87.03,36.74 87.59,36.18 89.13,36.18 90.11,37.16 90.11,38.14 88.57,39.67 87.59,39.67 87.03,39.12 C21.2 | 78.37,34.23 78.93,34.23 IC3.37 | 78.37,34.23 v78.37,33.95 | 35.83,39.19 36.23,39.19 36.56,39.52 36.56,39.61 40.4,43.45 52.66,43.45 53.07,43.85 53.3,43.85 54.01,44.56 54.93,44.56 55.26,44.23 55.26,42.01 v53.7,40.45 | IC3.43 81.34,33.49 81.17,33.31 81.17,32.67 v80.9,32.4 | IC3.19 80.94,41.25 81.44,41.75 v84.8,41.75
  Top 0.203: IC5.4 53.33,40.08 v53.7,40.45
  Top 0.305: IC5.2 IC5.4 TP2.P$1 58.33,38.21 58.35,38.19 C27.1 C26.1
  Bottom 0.152: 72.75,40.45 72.75,39.2 v72.8,39.15 | DSP1.D22 64.08,10.85 | DSP1.D25 61.98,10.85 64.08,10.85 | 64.08,10.85 64.08,18.52 68.6,23.05 v68.6,23.65 68.63,23.65 71.44,26.45 75.69,26.45 76.76,27.52 82.56,27.52 | 82.56,27.52 v82.56,32.41 | 86.19,23.89 88.71,21.37 RE1.1 | 86.19,23.89 82.56,27.52 | v82.56,32.41 v83.96,33.81 83.96,34.19 83.4,34.75 79.17,34.75 v78.37,33.95 | v87.17,24.73 86.33,23.89 86.19,23.89 | v31.57,33.11 v31.57,19.84 | 73.06,40.45 73.06,40.51 72.81,40.75 72.81,42.86 73.01,43.05 73.01,44.98 JP1.6 | v84.8,41.75 84.8,40.15 84.15,39.5 | v82.56,32.41 v82.55,32.4 v80.9,32.4
  Bottom 0.2: 84.2,39.45 84.15,39.5 80.23,39.5 79.25,38.52 79.25,37.67 78.53,36.95 76.53,36.95 74.05,39.43 74.05,39.46 73.06,40.45
  Bottom 0.203: 73.06,40.45 72.75,40.45 64.77,40.45 62.84,42.38 62.36,42.38 60.43,40.45 v53.7,40.45 | v85.05,35.9 85.05,38.6 84.2,39.45
FLASH_SCK  (via drill 0.3)
  Top 0.152: IC2.6 81.67,45.41 v81.65,45.4 | IC3.31 78.17,36.86 77.65,36.86 77.37,36.58 75.56,36.58 74.55,37.58 74.55,38.96 74.09,39.42 74.09,40.09 v75.1,41.1
  Bottom 0.152: v75.1,41.1 75.1,43.8 76.7,45.4 v81.65,45.4
FLASH_SCS  (via drill 0.3)
  Top 0.152: 88.71,42.75 IC2.1 88.8,42.85 v90,42.85 | 78.17,37.26 IC3.30 77.63,37.28 77.21,36.86 75.67,36.86 74.83,37.7 74.83,39.47 v74.65,39.65
  Bottom 0.152: v74.65,39.65 73.76,40.54 73.42,40.54 73.09,40.87 73.09,42.74 73.29,42.93 73.29,43.19 74.16,44.05 74.16,44.95 77.29,48.08 88.6,48.08 90.94,45.75 90.94,44.69 90.56,44.31 90.56,43.92 90.33,43.7 90.33,43.19 v90,42.85
FLASH_SDI  (via drill 0.3)
  Top 0.152: v81.4,47 81.75,46.65 82.89,46.65 IC2.5 | IC3.33 77.67,36.08 77.61,36.02 75.33,36.02 73.99,37.35 73.99,38.73 73.53,39.19 73.53,40.42 73.65,40.54 v73.65,41.1
  Bottom 0.152: v81.4,47 76.6,47 74.44,44.84 74.44,43.94 73.65,43.15 v73.65,41.1
FLASH_SDO  (via drill 0.3)
  Top 0.152: 88.85,44.01 88.79,44.11 | 88.79,44.11 IC2.2 | v90,44.15 89.96,44.11 88.79,44.11 | IC3.32 77.67,36.48 77.49,36.3 75.44,36.3 74.27,37.47 74.27,38.84 73.81,39.3 73.81,40.31 74.27,40.77 74.27,41.31 v74.38,41.42
  Bottom 0.152: v90,44.15 90.66,44.81 90.66,45.63 88.48,47.8 84.04,47.8 82.59,46.35 77.25,46.35 74.38,43.47 v74.38,41.42
FLASH_SHD  (via drill 0.3)
  Top 0.152: v81.55,44.15 IC2.7 | v76.52,41.52 76.52,41.04 76.07,40.59 75.96,40.59 75.49,40.12 75.49,39.3 75.41,39.23 75.41,37.9 75.9,37.41 76.96,37.41 77.62,38.08 IC3.28
  Bottom 0.152: v76.52,41.52 76.52,42.81 78.05,44.35 81.35,44.35 v81.55,44.15
FLASH_SWP  (via drill 0.3)
  Top 0.152: v90.1,45.4 88.78,45.4 IC2.3 | IC3.29 77.63,37.68 77.08,37.13 75.79,37.13 75.14,37.79 75.14,39.35 75.21,39.42 75.21,40.42 75.66,40.87 75.66,40.97 v75.84,41.15
  Bottom 0.152: v75.84,41.15 75.84,42.53 78.11,44.8 81.84,44.8 83.16,46.12 83.16,46.53 84.16,47.52 87.98,47.52 v90.1,45.4
FLASH_VDD  (via drill 0.3)
  Top 0.152: IC2.8 82.89,42.84 82.07,42.84 80.63,44.28 80.33,44.28 C4.2 80.19,44.28 79.21,44.28 C22.2 79.14,44.25 v78.33,43.44 | IC3.26 77.58,38.88 76.95,38.25 v76.25,38.25
  Bottom 0.152: v76.25,38.25 76.25,39.31 76.71,39.77 76.71,40.52 77.35,41.17 77.35,42.46 v78.33,43.44
GND  (via drill 0.3)
  Top 0.152: v54.1,35.05 54.15,35.05 v54.95,35.85 55.91,34.9 C27.2 | C17.2 C16.2 67.56,24.51 67.56,23.8 68.31,23.05 76.01,23.05 76.24,23.28 76.24,24.52 C10.1 | R4.2 C10.1 | C10.1 C11.1 C12.1 77.39,25.7 78.23,26.54 78.23,28.22 | 78.23,28.22 78.23,29.62 C1.1 78.37,29.76 78.37,30.73 C2.1 78.23,30.87 75.72,30.87 68.73,37.86 | 83.82,27.24 84.29,27.71 84.29,28.08 84.62,28.41 85.08,28.41 86.25,27.24 86.47,27.24 | 83.82,27.24 83.82,26.82 C19.2 | 83.82,27.24 83.17,27.89 Y1.2 | 86.47,27.24 86.89,26.82 C18.2 | 83.11,29.21 83.12,29.2 Y1.2 | 83.11,29.21 82.98,29.34 | 82.98,29.34 81.44,30.87 81.03,30.87 Y1.4 | C9.1 87.03,34.23 89.97,34.23 C8.1 90.11,34.09 90.11,31.43 | 88.01,29.9 88.01,30.73 C25.1 | 90.53,25.15 90.67,25.29 90.67,26.12 90.11,26.68 R3.1 | 90.11,31.43 89.69,31.43 89.13,30.87 C24.1 89.13,30.73 89.13,29.9 C23.1 88.99,29.9 88.01,29.9 | 88.01,29.9 C6.1 86.47,28.26 86.47,27.24 | 78.23,28.22 82.11,28.22 83.11,29.21 | 82.98,29.34 Y1.2 | C22.1 C4.1 80.91,45.31 81.45,44.77 84.22,44.77 v84.85,44.85 84.94,44.84 85.78,44.84 IC2.9 | 85.78,43.87 84.94,43.87 v84.85,43.85 | 85.78,43.87 v85.85,43.85 85.92,43.87 86.75,43.87 v86.85,43.85 | 85.78,43.87 IC2.9 | 85.92,44.84 IC2.9 | 85.92,44.84 86.75,44.84 v86.85,44.85 86.89,44.98 86.89,45.82 v86.85,45.85 86.89,45.96 87.59,46.66 88.71,46.66 | 85.92,44.84 v85.85,44.85 | 85.78,45.82 84.94,45.82 v84.85,45.85 | 85.78,45.82 v85.85,45.85 | 85.78,45.82 IC2.9 | 88.71,46.66 IC2.4 | v80.15,37.6 80.19,37.58 81.03,37.58 IC3.49 | 81.03,38.7 80.19,38.7 v80.15,38.6 | v81.15,35.6 81.17,35.62 81.17,36.46 IC3.49 | IC3.49 81.17,36.6 v81.15,36.6 81.03,36.6 80.19,36.6 v80.15,36.6
  Top 0.152: v81.15,37.6 81.17,37.58 IC3.49 | 81.03,38.7 v81.15,38.6 | 81.03,38.7 IC3.49 | v82.15,35.6 82.28,35.62 82.28,36.46 IC3.49 | v82.15,36.6 v82.14,36.6 IC3.49 | 82.28,38.56 82.28,37.72 v82.15,37.6 | 82.28,38.56 v82.15,38.6 | 82.28,38.56 IC3.49 | v88.99,36.88 88.01,36.88 C20.1 | C21.1 87.99,39.03 88.63,39.03 88.99,38.67 v88.99,38.42 | R45.1 21.65,31.71 22.63,31.71 R46.1 22.77,31.71 24.03,32.97 | 24.03,32.97 24.17,33.11 v26.96,33.11 29.48,33.11 C3.2 | Q9.2 16.32,36.34 16.14,36.52 16.14,38.78 16.3,38.95 R42.2 17.76,39.66 19.48,39.66 20.3,38.84 23.33,38.84 | R2.2 29.48,39.12 27.24,39.12 C36.2 26.08,39.08 25.84,38.84 24.67,38.84 24.07,39.44 | 24.17,39.53 24.17,39.81 IC12.6 24.17,39.53 | 23.33,38.84 23.47,38.84 24.07,39.44 | 24.17,39.53 24.07,39.44 | 24.03,32.97 23.47,33.53 23.47,38 23.33,38.14 23.33,38.84 | JP1.5 71.94,43.45 68.82,40.32 C29.2 68.73,39.81 68.73,37.86 | v26,68 26.12,68.03 27.94,68.03 R48.GND3 | v28,68 28.08,68.03 R48.GND3 | v30,68 30.04,68.03 R48.GND3 | v32,68 31.99,68.03 R48.GND3 | v34,68 34.09,68.03 34.09,68.17 R48.GND3 | v36,68 36.04,68.03 36.04,68.17 R48.GND3 | v38,68 38.14,68.03 38.14,68.31 R48.GND3 | v40,68 40.09,68.03 40.09,68.31 R48.GND3 | v42,68 41.91,68.03 41.63,68.31 R48.GND3 | v44,68 44.01,68.03 44.01,68.45 R48.GND3 | v46,68 46.1,68.03 46.1,68.59 R48.GND3 | v48,68 48.06,68.03 48.06,68.59 R48.GND3 | v50,68 50.01,68.03 R48.GND3 | v52,68 52.11,68.03 R48.GND3 | R48.GND3 53.09,67.06 53.92,67.89 v54,68 54.06,68.03 55.88,68.03 v56,68 | 59.93,68.03 58.12,68.03 v58,68 | 59.93,68.03 v60,68 60.07,68.03 61.89,68.03 v62,68 | 59.93,68.03 R48.GND3 | 65.94,68.03 64.12,68.03 v64,68 | 65.94,68.03 v66,68 66.08,68.03 67.89,68.03 v68,68 68.03,68.17 68.03,69.99 v68,70
  Top 0.152: 65.94,68.03 R48.GND3 | 71.94,68.03 70.13,68.03 v70,68 | 71.94,68.03 v72,68 72.08,68.03 73.9,68.03 v74,68 | 71.94,68.03 R48.GND3 | v26,70 26.12,69.99 27.94,69.99 R48.GND3 | v28,70 28.08,69.99 R48.GND3 | v30,70 30.04,69.99 30.04,69.85 R48.GND3 | v32,70 v31.99,69.99 31.99,69.85 R48.GND3 | v34,70 34.09,69.99 34.09,69.71 R48.GND3 | v36,70 35.9,69.99 35.62,69.71 R48.GND3 | v38,70 38.14,69.99 38.14,69.57 R48.GND3 | v40,70 40.09,69.99 40.09,69.43 R48.GND3 | v42,70 42.05,69.99 42.05,69.29 R48.GND3 | v44,70 v44.01,69.99 44.01,69.15 R48.GND3 | v46,70 46.1,69.99 46.1,69.01 R48.GND3 | v48,70 48.06,69.99 48.06,68.87 R48.GND3 | v50,70 50.01,69.99 50.01,69.57 R48.GND3 | v52,70 52.11,69.99 52.11,68.73 R48.GND3 | v54,70 54.06,69.99 54.06,68.59 R48.GND3 | v56,70 56.02,69.99 56.02,68.59 R48.GND3 | v58,70 58.12,69.99 58.12,68.45 R48.GND3 | v60,70 60.07,69.99 60.07,68.45 R48.GND3 | v62,70 61.89,69.99 61.89,68.45 R48.GND3 | v64,70 64.12,69.99 64.12,68.31 R48.GND3 | v66,70 65.94,69.99 65.94,68.31 R48.GND3 | 71.94,69.99 70.13,69.99 v70,70 | 71.94,69.99 v72,70 72.08,69.99 73.9,69.99 v74,70 | 71.94,69.99 R48.GND3 | 26.12,73.9 26.12,72.08 v26,72 | v28,72 28.08,72.08 28.08,73.48 R48.GND3 | v30,72 30.04,72.08 30.04,73.06 R48.GND3 | v32,72 32.13,72.08 32.13,72.64 R48.GND3 | v34,72 34.09,72.08 34.09,72.22 R48.GND3 | v36,72 36.04,71.94 36.04,71.81 R48.GND3 | v38,72 38.14,71.94 38.14,71.39 R48.GND3 | v40,72 40.09,71.94 40.09,70.97 R48.GND3 | v42,72 42.05,71.94 42.05,70.55 R48.GND3 | 44.01,73.9 44.01,72.08 v44,72 | v46,72 46.1,72.08 R48.GND3 | v48,72 47.92,71.94 47.22,71.25 R48.GND3 | v50,72 50.01,72.08 50.01,73.9 R48.GND3 | 52.11,73.9 52.11,72.08 v52,72
  Top 0.152: 54.06,73.9 54.06,72.08 v54,72 | 56.02,73.9 56.02,72.08 v56,72 | 58.12,73.9 58.12,72.08 v58,72 | 60.07,73.9 60.07,72.08 v60,72 | 62.03,73.9 62.03,72.08 v62,72 | 64.12,73.9 64.12,72.08 v64,72 | 66.08,73.9 66.08,72.08 v66,72 | 68.03,73.9 68.03,72.08 v68,72 | 70.13,73.9 70.13,72.08 v70,72 | 72.08,73.9 72.08,72.08 v72,72 | 74.04,73.9 74.04,72.08 v74,72 | 26.12,73.9 v26,74 | 26.12,73.9 R48.GND3 | v28,74 27.94,73.9 27.66,73.62 R48.GND3 | v30,74 29.9,73.9 29.9,73.2 R48.GND3 | v32,74 32.13,73.9 32.13,72.78 R48.GND3 | R48.GND3 34.09,72.36 34.09,73.9 v34,74 34.09,74.04 35.9,74.04 v36,74 | v38,74 38.14,74.04 39.95,74.04 R48.GND3 | v40,74 40.09,74.04 R48.GND3 | v42,74 41.91,73.9 41.35,73.34 R48.GND3 | 44.01,73.9 v44,74 | 44.01,73.9 R48.GND3 | v46,74 45.96,73.9 45.12,73.06 R48.GND3 | 49.87,74.04 48.06,74.04 v48,74 | 49.87,74.04 v50,74 | 49.87,74.04 R48.GND3 | 52.11,73.9 v52,74 | 52.11,73.9 R48.GND3 | 54.06,73.9 v54,74 | 54.06,73.9 R48.GND3 | 56.02,73.9 v56,74 | 56.02,73.9 R48.GND3 | 58.12,73.9 v58,74 | 58.12,73.9 R48.GND3 | 60.07,73.9 v60,74 | 60.07,73.9 R48.GND3 | 62.03,73.9 v62,74 | 62.03,73.9 R48.GND3 | 64.12,73.9 v64,74 | 64.12,73.9 R48.GND3 | 66.08,73.9 v66,74 | 66.08,73.9 R48.GND3 | 68.03,73.9 v68,74 | 68.03,73.9 R48.GND3 | 70.13,73.9 v70,74 | 70.13,73.9 R48.GND3 | 72.08,73.9 v72,74 | 72.08,73.9 R48.GND3 | 74.04,73.9 v74,74 | 74.04,73.9 R48.GND3 | v26,76 26.12,76 27.94,76 R48.GND3 | v28,76 28.08,76 R48.GND3 | v30,76 30.04,76 30.04,75.44 R48.GND3 | v32,76 32.13,76 32.13,74.74 R48.GND3 | v34,76 34.09,76 35.9,76 R48.GND3 | v36,76 36.04,76 R48.GND3 | v38,76 38,75.02 R48.GND3 | 41.91,76 40.09,76 v40,76 | 41.91,76 v42,76 | 41.91,76 R48.GND3 | v44,76 43.87,76 43.03,75.16 42.89,75.16 R48.GND3
  Top 0.152: 47.92,76 46.1,76 v46,76 | 47.92,76 v48,76 48.06,76 49.87,76 v50,76 | 47.92,76 R48.GND3 | 53.92,76 52.11,76 v52,76 | 53.92,76 v54,76 54.06,76 55.88,76 v56,76 | 53.92,76 R48.GND3 | 59.93,76 58.12,76 v58,76 | 59.93,76 v60,76 60.07,76 61.89,76 v62,76 | 59.93,76 R48.GND3 | 65.94,76 64.12,76 v64,76 | 65.94,76 v66,76 66.08,76 67.89,76 v68,76 | 65.94,76 R48.GND3 | 71.94,76 70.13,76 v70,76 | 71.94,76 v72,76 72.08,76 73.9,76 v74,76 | 71.94,76 R48.GND3 | v26,78 26.12,78.09 27.94,78.09 R48.GND3 | v28,78 28.08,78.09 R48.GND3 | v30,78 29.9,77.95 29.9,77.39 R48.GND3 | v32,78 31.99,77.95 31.99,76.56 R48.GND3 | v34,78 34.09,78.09 35.9,78.09 R48.GND3 | v36,78 36.04,78.09 R48.GND3 | v38,78 38,77.95 37.3,77.25 R48.GND3 | 41.91,78.09 40.09,78.09 v40,78 | 41.91,78.09 v42,78 | 41.91,78.09 R48.GND3 | v44,78 43.87,77.95 42.89,76.97 R48.GND3 | 47.92,78.09 46.1,78.09 v46,78 | 47.92,78.09 v48,78 48.06,78.09 49.87,78.09 v50,78 | 47.92,78.09 R48.GND3 | 53.92,78.09 52.11,78.09 v52,78 | 53.92,78.09 v54,78 54.06,78.09 55.88,78.09 v56,78 | 53.92,78.09 R48.GND3 | 59.93,78.09 58.12,78.09 v58,78 | 59.93,78.09 v60,78 60.07,78.09 61.89,78.09 v62,78 | 59.93,78.09 R48.GND3 | 65.94,78.09 64.12,78.09 v64,78 | 65.94,78.09 v66,78 66.08,78.09 67.89,78.09 v68,78 | 65.94,78.09 R48.GND3 | 71.94,78.09 70.13,78.09 v70,78 | 71.94,78.09 v72,78 72.08,78.09 73.9,78.09 v74,78 | 71.94,78.09 R48.GND3 | Q1.2 52.07,40.92 51.13,39.98 51.13,33.59 v51.05,33.55 | v38.7,40.09 38.94,40.33 40.1,40.33 IC1.12 | 68.73,37.86 66.22,35.34 64.12,35.34 Q2.2 64.06,36.44 63.9,36.6 62.78,36.6 62.43,36.95 62.43,38.85 62.1,39.18 61.44,39.18 60.57,38.31 60.57,35.8 C26.2 | 90.53,25.15 91.22,24.45 91.22,6.84 RE1.C1
  Top 0.152: 92.2,39.75 92.05,39.6 | 92.05,39.6 91.85,39.4 91.85,38.05 92.35,37.55 | 92.05,39.6 91.5,40.15 91.5,41.52 92.01,42.02 92.01,43.43 91.61,43.83 91.61,45.59 90.54,46.66 88.71,46.66 | 90.11,31.43 90.42,31.43 90.64,31.2 90.64,29.41 89.84,28.61 89.22,28.61 88.89,28.28 88.89,25.98 89.72,25.15 90.53,25.15
  Top 0.305: C28.1 58.22,34.77 C27.2 C26.2 | v51.05,33.55 IC5.1
  Top 1.016: E1.GND2 92.2,39.75 | E1.GND 92.35,37.55
  Top 1.7: J1.1 41.08,7.76 33.99,7.76 J2.2 | R48.GND3 58.25,60.78 R48.GND2
  Top 1.9: R48.GND3 58.3,60.73 58.3,54.95 79.95,54.95 79.95,82.4 20.2,82.4 20.2,54.95 57.55,54.95
  Bottom 0.152: v51.05,33.55 51.35,33.55 52.85,35.05 v54.1,35.05 | 79.61,36.06 79.4,35.85 74.14,35.85 73.88,35.59 73.42,35.59 73.16,35.85 v54.95,35.85 | 79.61,36.06 v80.15,36.6 | DSP1.D30 58.48,4.85 62.67,4.85 | DSP1.D24 62.67,4.85 | 62.67,4.85 63.38,4.85 | 63.38,4.85 DSP1.D23 | 63.38,4.85 64.78,4.85 | 64.78,4.85 DSP1.D21 | 64.78,4.85 66.17,4.85 | 66.17,4.85 DSP1.D19 | 66.17,4.85 66.88,4.85 | 66.88,4.85 DSP1.D18 | 66.88,4.85 68.28,4.85 | 68.28,4.85 DSP1.D16 | 68.28,4.85 68.97,4.85 | 68.97,4.85 DSP1.D15 | 68.97,4.85 69.67,4.85 | 69.67,4.85 DSP1.D14 | 69.67,4.85 72.47,4.85 | DSP1.D10 72.47,4.85 | 72.47,4.85 73.17,4.85 | DSP1.D9 73.17,4.85 | 73.17,4.85 73.88,4.85 | DSP1.D8 73.88,4.85 | 73.88,4.85 74.58,4.85 | DSP1.D7 74.58,4.85 | 74.58,4.85 75.28,4.85 | 75.28,4.85 DSP1.D6 | 75.28,4.85 78.08,4.85 | 78.08,4.85 DSP1.D2 | 78.08,4.85 78.78,4.85 | 78.78,4.85 DSP1.D1 | RE1.C1 91.23,4.48 90.6,3.85 79.78,3.85 78.78,4.85 | v82.15,35.6 82.28,35.48 82.46,35.31 83.63,35.31 83.74,35.2 85.22,35.2 86.89,36.88 v88.99,36.88 v88.99,38.42 86.89,40.51 86.89,43.73 v86.85,43.85 | 79.61,36.06 80.05,35.62 v80.15,35.6 | v26.96,33.11 26.65,33.11 | v38.7,40.09 36.44,40.09 36.23,40.31 35.77,40.31 34.96,39.49 28.47,39.49 27.87,40.09 26.65,40.09
  Bottom 0.305: J1.1 52.6,19.28 52.6,32 v51.05,33.55
  Bottom 1.7: R48.2 85.75,74.28 R48.GND2 R48.GND 26.65,59.18 26.65,40.09 26.65,33.11 26.65,24.52 28.68,22.49 28.68,20.56 28.67,20.55 28.67,13.08 J2.2
  pour Top: 0,0 0,74.3 15.1,89.4 85.25,89.4 100.45,74.2 100.45,0.05 0.05,0.05
  pour Bottom: 0,0 0,74.3 15.1,89.4 85.3,89.4 100.4,74.3 100.4,0.05 0.05,0.05
N$1
  Top 0.305: R39.1 4.19,18.2 Q8.D
N$2
  Top 0.305: Q8.G 5.16,22.78 IC11.6
N$3
  Top 0.305: R37.1 8.08,18.18 Q7.D
N$4
  Top 0.152: R40.2 3.63,28.36 4.61,27.38 C35.1 4.61,27.24 4.19,26.82 4.19,25.43 IC11.2
N$5
  Top 0.305: Q7.G 9.01,22.77 IC10.6
N$6
  Top 0.152: R38.2 7.68,28.36 7.68,28.23 8.57,27.34 C34.1 8.55,27.18 8.09,26.72 8.09,25.34 IC10.2
N$7
  Top 0.305: R35.1 11.97,18.14 Q6.D
N$8
  Top 0.305: Q6.G IC9.6
N$9
  Top 0.152: R36.2 11.48,28.33 12.43,27.37 12.43,27.24 C33.1 12.01,26.73 12.01,25.43 IC9.2
N$10
  Top 0.305: R33.1 Q5.D
N$11
  Top 0.305: Q5.G IC8.6
N$12
  Top 0.152: R34.2 15.27,28.37 16.33,27.31 C32.1 16.35,27.2 15.88,26.73 15.88,25.35 IC8.2
N$13
  Top 0.305: R31.1 19.71,16.09 Q4.D
N$14
  Top 0.305: Q4.G 20.66,22.76 IC7.6
N$15
  Top 0.152: R32.2 19.22,28.38 20.24,27.36 C31.1 20.12,27.24 19.84,26.96 19.84,25.43 IC7.2
N$16
  Top 0.305: R29.1 Q3.D
N$17
  Top 0.305: Q3.G 24.56,21.71 24.61,21.76 IC6.6
N$18
  Top 0.152: R30.2 23.1,28.3 24.03,27.37 24.03,27.24 C30.1 24.03,27.1 23.75,26.82 23.75,25.43 IC6.2
N$19
  Top 1.7: J2.1 35.09,14.2 D3.2
N$20
  Top 0.152: R2.1 32.99,39.07 IC1.15
N$21
  Top 0.152: D4.2 48.34,44.28 50.99,44.28 Q1.3 53.41,44.35 53.89,44.84 55.05,44.84 56.59,43.29 60.35,43.29 J3.3
N$22
  Top 0.152: Q1.1 50.16,42.07 50.82,42.73 53.02,42.73 R12.2
N$23
  Top 0.18: IC3.2 85.51,35.28 85.52,35.27
  Top 0.45: C7.1 C9.2 86.93,35.27 85.52,35.27
N$24
  Top 0.152: 85.92,29.9 85.92,30.73 R1.2 85.78,30.87 83.35,33.3 IC3.48 | 85.92,29.9 86.89,29.9 C6.2 | 85.92,29.9 C5.1
N$25
  Top 0.152: C5.2 84.8,29.9 84.8,30.73 R1.1 84.82,31.23 84.45,31.6 84.3,31.6 82.94,32.96 IC3.47
N$26
  Top 0.152: 79.35,30.87 C2.2 79.99,31.48 79.99,31.63 80.16,31.8 82.15,31.8 | 83.12,31.01 Y1.3 83.03,30.92 82.15,31.8 | IC3.44 81.74,33.49 81.45,33.2 81.45,32.74 82.15,32.04 82.15,31.8
N$27  (via drill 0.3)
  Top 0.152: 79.35,29.62 80.61,29.62 80.89,29.34 Y1.1 | v82,32.97 82.14,33.11 82.14,34.09 IC3.45 | 79.35,29.62 v79.35,28.78 | 79.35,29.62 C1.2
  Bottom 0.152: v82,32.97 81.99,32.96 80.67,32.96 80.34,32.63 80.34,32.17 80.35,32.16 80.35,29.4 79.73,28.78 v79.35,28.78
N$28  (via drill 0.3)
  Top 0.152: v60.54,10.43 60.54,9.03 60.63,8.94 65.91,8.94 67.75,10.78 67.75,23.17 64.8,26.13 63.71,26.13 63.18,25.6 C15.1
  Bottom 0.152: v60.54,10.43 60.59,10.38 60.59,7.83 DSP1.D27
N$29
  Top 0.45: E1.ANT 91.24,36.37 C8.2 C7.2
N$30  (via drill 0.3)
  Top 0.152: C17.1 68.59,25.7 v68.59,26.54 69.27,27.22 70.01,27.22 70.11,27.11 70.26,27.11 70.55,26.82 R5.1 | v65.52,10.78 v65.52,22.21
  Bottom 0.152: v68.59,26.54 68.59,25.29 v65.52,22.21 | 65.52,10.09 65.52,7.82 DSP1.D20 | DSP1.D17 67.58,9.86 67.35,10.09 65.52,10.09 | DSP1.D17 | 65.52,10.09 v65.52,10.78
N$31  (via drill 0.3)
  Top 0.152: v74.88,23.61 75.16,23.89 75.16,24.45 C10.2
  Bottom 0.152: v74.88,23.61 74.88,12.69 76.66,10.91 76.66,7.82 DSP1.D4
N$32  (via drill 0.3)
  Top 0.152: C15.2 64.18,25.61 64.91,25.61 67.47,23.05 67.47,10.9 65.8,9.22 62.24,9.22 61.28,10.18 v61.28,11.03
  Bottom 0.152: v61.28,11.03 DSP1.D26
N$33  (via drill 0.3)
  Top 0.152: C12.2 78.32,25.62 78.32,24.57 C11.2 78.31,24.54 78.28,24.5 78.28,10.11 v78.23,10.06
  Bottom 0.152: v78.23,10.06 77.53,10.06 77.39,9.92 77.39,7.82 DSP1.D3
N$34  (via drill 0.3)
  Top 0.152: R4.1 74.37,25.63 74.18,25.44 v74.18,24.59
  Bottom 0.152: v74.18,24.59 74.18,12.79 75.96,11.01 75.96,7.82 DSP1.D5
N$35  (via drill 0.3)
  Top 0.152: v63.14,23.33 63.14,24.45 C14.1
  Bottom 0.152: v63.14,23.33 63.14,18.44 59.23,14.53 59.23,7.82 DSP1.D29
N$36  (via drill 0.3)
  Top 0.152: v64.12,23.33 64.12,24.45 C14.2
  Bottom 0.152: v64.12,23.33 64.12,19 59.93,14.81 59.93,7.82 DSP1.D28
N$37
  Top 0.152: R41.2 17.04,32.55 17.04,31.71 R44.2 16.9,31.71 13.27,31.71 13.13,31.85 Q10.1
N$38  (via drill 0.3)
  Top 0.152: v4.55,32.3 4.61,32.27 5.45,32.27 v5.55,32.3 5.59,32.27 6.43,32.27 v6.55,32.3 6.57,32.41 6.57,33.25 v6.55,33.3 6.57,33.39 6.57,33.53 Q10.2 | v4.55,33.3 4.61,33.39 4.61,34.23 v4.55,34.3 4.61,34.37 5.17,34.92 Q10.2 | v7.55,32.3 7.68,32.27 8.52,32.27 v8.55,32.3 8.66,32.41 8.66,33.25 v8.55,33.3 8.66,33.39 8.66,34.23 | v5.55,33.3 5.59,33.39 5.87,33.67 Q10.2 | v7.55,33.3 7.54,33.39 7.12,33.81 Q10.2 | v5.55,34.3 5.59,34.37 Q10.2 | v6.55,34.3 6.57,34.37 Q10.2 | v7.55,34.3 7.68,34.23 Q10.2 | 8.66,34.23 v8.55,34.3 | 8.66,34.23 Q10.2 | v4.55,35.3 4.61,35.34 Q10.2 | v5.55,35.3 5.59,35.34 Q10.2 | v6.55,35.3 6.57,35.34 Q10.2 | v7.55,35.3 7.54,35.2 7.26,34.92 Q10.2 | 8.66,36.18 8.66,35.34 v8.55,35.3 | v4.55,36.3 4.61,36.32 Q10.2 | v5.55,36.3 5.59,36.32 Q10.2 | v6.55,36.3 6.43,36.18 6.15,35.9 Q10.2 | v7.55,36.3 7.68,36.18 8.1,35.76 Q10.2 | 8.66,36.18 v8.55,36.3 8.64,36.3 12.28,39.94 21.52,39.94 IC12.8 | 8.66,36.18 Q10.2
  Top 1.7: Q10.2 6.48,34.6 4.07,37.01 R47.1
N$39
  Top 0.152: IC3.7 84.11,37.3 86.34,37.3 C13.2
N$40
  Top 0.152: R45.2 21.6,34.42 IC12.1
N$41
  Top 1.7: J1.2 D1.2
N$42
  Top 0.152: TP1.P$1 30.18,30.73 30.18,27.52 FC1.P1
  Top 1.7: D1.1 35.11,20.83 D3.1 35.09,26.75 | 35.09,26.75 FC1.P2 | FC1.P1 35.07,26.77 35.09,26.75
N$43
  Top 0.152: D2.2 43.12,32.78 42.17,32.78 41.58,33.2 IC1.1
N$46
  Top 0.152: R47.2 10.59,40.93 22.25,40.93 22.77,40.41 22.77,39.95 IC12.7
  Top 1.7: R47.2 10.17,74.2 R48.1
N$47
  Top 0.152: R41.1 18.02,32.69 18.02,34.23 Q9.3
N$48
  Top 0.152: R42.1 17.18,38 18.02,38 R43.2 18.16,37.86 18.16,36.53 18.36,36.34 Q9.1
N$49
  Top 0.152: R46.2 22.77,32.69 22.77,34.37 IC12.2
N$66
  Top 0.152: SP1.N Q2.3 D5.2
N$69
  Top 0.152: R16.2 62.17,33.67 62.17,35.2 Q2.1
N$79
  Top 0.152: RGB1.P3 28.37,16.85 28.96,17.43 28.96,19.84 R15.1
N$80
  Top 0.152: RGB1.P1 31.36,16.86 30.63,17.58 30.63,19.59 31,19.96 R13.1
N$81
  Top 0.152: R14.1 27.94,21.89 27.38,21.33 27.38,20 28.03,19.41 RGB1.P2
RESET  (via drill 0.3)
  Top 0.152: R10.1 75.86,44.28 v73.6,44.28 72.64,44.28 72.36,44.56 70.41,44.56 69.43,43.59 JP1.3 | v90.92,40.83 90.67,40.83 89.79,39.96 86.73,39.96 84.86,38.08 IC3.9 | v74.45,48.4 73.85,47.8 v73.85,46.4
  Bottom 0.152: v74.45,48.4 74.9,48.4 75.98,49.48 89.18,49.48 92.33,46.33 92.33,42.24 v90.92,40.83 | v73.85,46.4 73.85,44.53 v73.6,44.28
U0RXD  (via drill 0.3)
  Top 0.152: v77.77,31.55 77.77,31.58 78.56,32.36 78.97,32.36 80.14,33.53 IC3.40 | v75.85,28.95 63.95,28.95 61.53,31.37 61.53,35.93 61.87,36.27 v61.87,38.62 | v63.2,41.1 65.85,43.75 65.85,43.91 66.46,44.52 67.93,44.52 JP1.4
  Bottom 0.152: v77.77,31.55 75.85,29.63 v75.85,28.95 | v61.87,38.62 61.87,39.77 v63.2,41.1
U0TXD  (via drill 0.3)
  Top 0.152: v78.51,31.53 78.69,31.71 78.69,31.76 79.02,32.08 79.09,32.08 80.54,33.53 IC3.41 | v76.4,27.95 70.46,27.95 70.33,28.08 63.97,28.08 60.85,31.2 60.85,37.8 v61.25,38.2 | v62.6,41.8 66.82,46.02 JP1.2
  Bottom 0.152: v78.51,31.53 78.33,31.35 78.33,31.32 76.74,29.73 76.74,28.29 v76.4,27.95 | v61.25,38.2 61.25,40.45 v62.6,41.8

## Text on the board
tPlace: 40MM FAN 12V | BDC REV. V1 | J3 | Dev. by Marvin Ramm | +3,3V | F1 | F2 | FC1 | FC2 | F: 230V 8A | DSP1 | RGB1 | Cell3 | - | +